# Altium schematic sheet Power.SchDoc
size A4; SheetNumber: 1; SheetTotal: 6
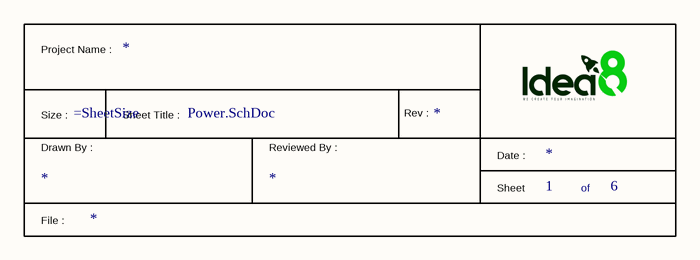
[diagram p0: Power.SchDoc]

## Parts
*  TitleBlock1  (value not drawn)  (graphical)

## Notes on the sheet
- (in symbol TitleBlock1) Project Name :; Size :; Sheet Title :; Rev :; Drawn By :; Reviewed By :; Date :; Sheet; of; File :